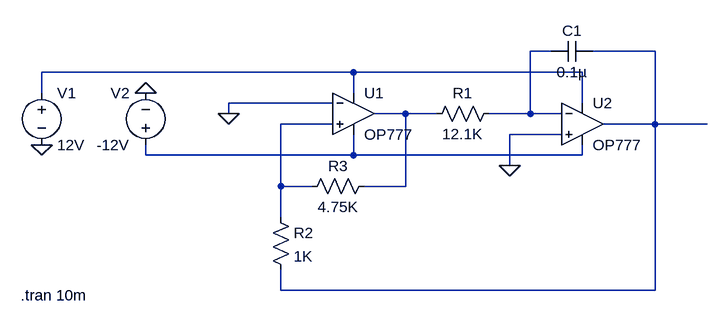
[diagram p0: schematic tri_wave1.asc]
tri_wave1.asc, the LTspice schematic file:
Version 4.1
SHEET 1 880 680
WIRE 352 32 320 32
WIRE 512 32 416 32
WIRE 48 64 -432 64
WIRE 400 64 48 64
WIRE -432 96 -432 64
WIRE 48 96 48 64
WIRE 16 112 -144 112
WIRE 400 112 400 64
WIRE -144 128 -144 112
WIRE 128 128 80 128
WIRE 176 128 128 128
WIRE 320 128 320 32
WIRE 320 128 256 128
WIRE 368 128 320 128
WIRE 16 144 -64 144
WIRE 512 144 512 32
WIRE 512 144 432 144
WIRE 592 144 512 144
WIRE 368 160 288 160
WIRE -272 192 -272 176
WIRE 48 192 48 160
WIRE 48 192 -272 192
WIRE 400 192 400 176
WIRE 400 192 48 192
WIRE 288 208 288 160
WIRE -64 240 -64 144
WIRE -16 240 -64 240
WIRE 128 240 128 128
WIRE 128 240 64 240
WIRE -64 288 -64 240
WIRE -64 400 -64 368
WIRE 512 400 512 144
WIRE 512 400 -64 400
FLAG 288 208 0
FLAG -144 128 0
FLAG -272 96 0
FLAG -432 176 0
SYMBOL OpAmps\\OP777 48 64 R0
SYMATTR InstName U1
SYMBOL OpAmps\\OP777 400 80 R0
SYMATTR InstName U2
SYMBOL res 272 112 R90
WINDOW 0 0 56 VBottom 2
WINDOW 3 32 56 VTop 2
SYMATTR InstName R1
SYMATTR Value 12.1K
SYMATTR SpiceLine tol=1 pwr=0.1
SYMBOL res -80 272 R0
SYMATTR InstName R2
SYMATTR Value 1K
SYMATTR SpiceLine tol=1 pwr=0.1
SYMBOL res 80 224 R90
WINDOW 0 0 56 VBottom 2
WINDOW 3 32 56 VTop 2
SYMATTR InstName R3
SYMATTR Value 4.75K
SYMATTR SpiceLine tol=1 pwr=0.1
SYMBOL cap 416 16 R90
WINDOW 0 0 32 VBottom 2
WINDOW 3 32 32 VTop 2
SYMATTR InstName C1
SYMATTR Value 0.1µ
SYMATTR SpiceLine V=16 Irms=3.85 Rser=0.0464862 Lser=0 mfg="KEMET" pn="C0402C104K4PAC" type="X5R"
SYMBOL voltage -432 80 R0
WINDOW 123 0 0 Left 0
WINDOW 39 0 0 Left 0
SYMATTR InstName V1
SYMATTR Value 12V
SYMBOL voltage -272 192 R180
WINDOW 0 24 96 Left 2
WINDOW 3 24 16 Left 2
WINDOW 123 0 0 Left 0
WINDOW 39 0 0 Left 0
SYMATTR InstName V2
SYMATTR Value -12V
TEXT -464 408 Left 2 !.tran 10m

The netlist it stands for:
* tri_wave1.asc
X§U1 N005 0 N003 N006 N004 OP777  ; pins In+ In- V+ V- OUT
X§U2 0 N001 N003 N006 N002 OP777  ; pins In+ In- V+ V- OUT
R1 N001 N004 12.1K tol=1 pwr=0.1
R2 N005 N002 1K tol=1 pwr=0.1
R3 N004 N005 4.75K tol=1 pwr=0.1
C1 N002 N001 0.1µ V=16 Irms=3.85 Rser=0.0464862 Lser=0 mfg="KEMET" pn="C0402C104K4PAC" type="X5R"
V1 N003 0 12V
V2 N006 0 -12V
.tran 10m
.lib ADI.lib
.backanno
.end